# EasyEDA Pro project satelitesbol.eprj, schematic ADCS
Board Name: PCB5; Create Date: 2025-08-22; Page Name: Main Board; Project Name: satelitesbol; Schematic Name: ADCS; Update Date: 2025-08-27; Company: EasyEDA.com; Page Size: A4; Version: V1.0
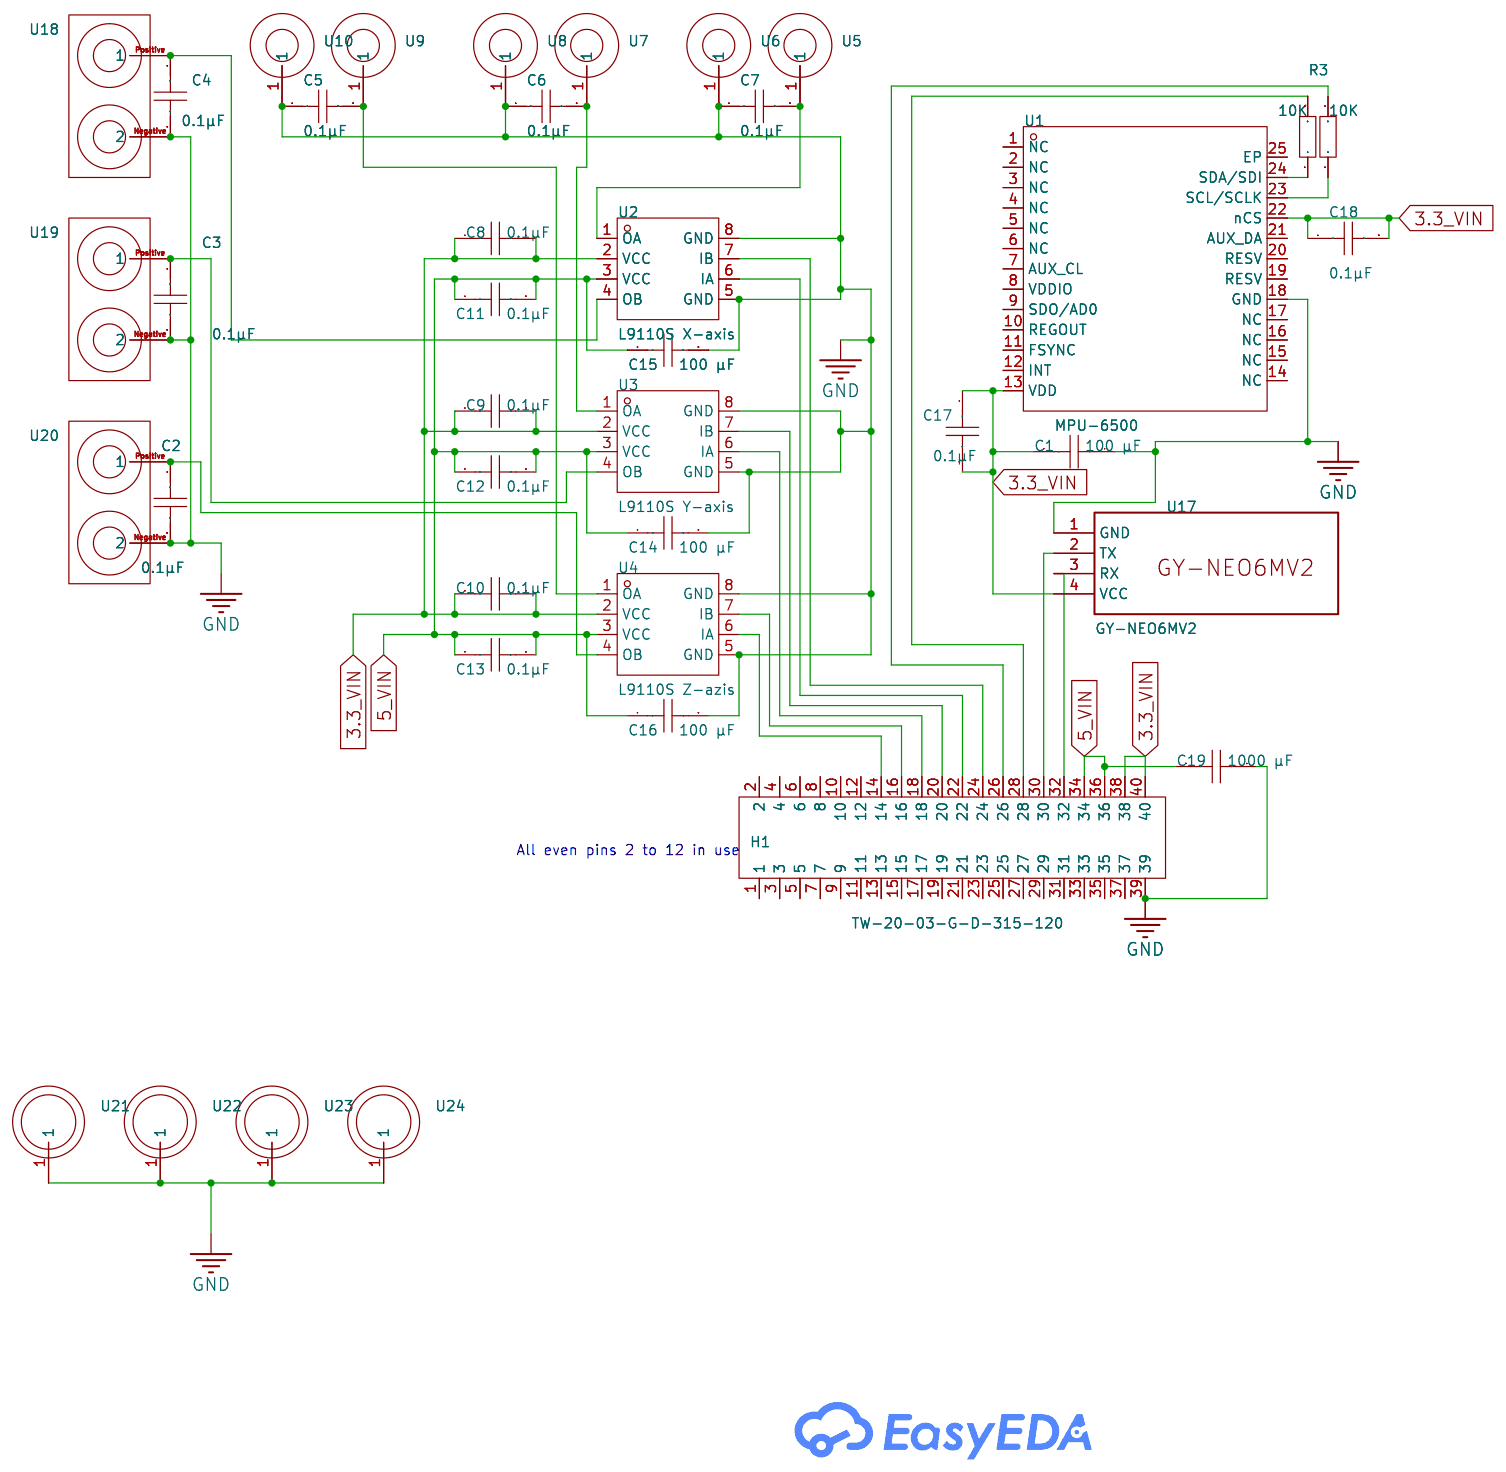
[diagram p2: schematic sheet]

## Parts
C1  100 µF  [C0805]
C2  0.1 µF  [C0805]
C3  0.1 µF  [C0805]
C4  0.1 µF  [C0805]
C5  0.1 µF  [C0805]
C6  0.1 µF  [C0805]
C7  0.1 µF  [C0805]
C8  0.1 µF  [C0805]
C9  0.1 µF  [C0805]
C10  0.1 µF  [C0805]
C11  0.1 µF  [C0805]
C12  0.1 µF  [C0805]
C13  0.1 µF  [C0805]
C14  100 µF  [C0805]
C15  100 µF  [C0805]
C16  100 µF  [C0805]
C17  0.1 µF  [C0805]
C18  0.1 µF  [C0805]
C19  1000 µF  [C0805]
H1  TW-20-03-G-D-315-120  [HDR-TH_40P-P2.00-V-M-R2-C20-S2.00-1]
R2  10K  [R0805]
R3  10K  [R0805]
U1  MPU-6500  [QFN-24_L3.0-W3.0-P0.40-BL-EP]
U2  L9110S X-axis  [SOP-8_L4.9-W3.9-P1.27-LS6.0-BL]
U3  L9110S Y-axis  [SOP-8_L4.9-W3.9-P1.27-LS6.0-BL]
U4  L9110S Z-azis  [SOP-8_L4.9-W3.9-P1.27-LS6.0-BL]
U5  -  [MOH]
U6  -  [MOH]
U7  -  [MOH]
U8  -  [MOH]
U9  -  [MOH]
U10  -  [MOH]
U17  GY-NEO6MV2  [NEO-6M-V2]
U18  -  [MG]
U19  -  [MG]
U20  -  [MG]
U21  -  [M_H]
U22  -  [M_H]
U23  -  [M_H]
U24  -  [M_H]

## Library data of the parts
C1-C19 = CAP_0201: Supplier Footprint: 0201
H1 = TW-20-03-G-D-315-120: LCSC Part Name: 间距:2mm 直插; Supplier Part: C7371248; Manufacturer: SAMTEC; Supplier Footprint: 插件,P=2mm; JLCPCB Part Class: Extended Part; Datasheet: https://item.szlcsc.com/datasheet/TW-20-03-G-D-315-120/8342295.html; Supplier: LCSC; Pitch: 2mm; Row Spacing: 2mm; Mounting Type: Through Hole; Number of Rows: 2; Number of Pins: 40P; Contact Plating: Gold; Color: Black
R2 R3 = Res_0603
U1 = MPU-6500_C50278: Supplier Part: C50278; Manufacturer: TDK InvenSense(应美盛); Supplier Footprint: QFN-24-EP(3x3); JLCPCB Part Class: Extended Part; Datasheet: https://item.szlcsc.com/datasheet/MPU-6500/51287.html; Supplier: LCSC; Sensor Type: Accelerometer gyroscope; Operating Temperature: -40℃~+85℃
U2-U4 = L9110S_C513306: LCSC Part Name: L9110; Supplier Part: C513306; Manufacturer: Mixic(中科芯亿达); Supplier Footprint: SOP-8; JLCPCB Part Class: Extended Part; Datasheet: https://item.szlcsc.com/datasheet/L9110S/528009.html; Supplier: LCSC; Peak Current: 2.5A; Operating Temperature: -20℃~+80℃
U5-U10 = MOH: motor holes
U17 = GY-NEO6MV2
U18-U20 = MG: magnetorquer
U21-U24 = M_H: mounting hole

## Nets
GND: C1.1 C2.2 C3.2 C4.2 C5.1 C6.1 C7.1 C14.2 C15.2 C16.2 C19.1 H1.39 U1.18(GND) U2.5(GND) U2.8(GND) U3.5(GND) U3.8(GND) U4.5(GND) U4.8(GND) U6.1 U8.1 U10.1 U17.1(GND) U18.Negative(2) U19.Negative(2) U20.Negative(2) U21.1 U22.1 U23.1 U24.1
3.3_VIN: C1.2 C8.1 C8.2 C9.1 C9.2 C10.1 C10.2 C17.1 C17.2 C18.1 C18.2 H1.38 H1.40 U1.13(VDD) U1.22(nCS) U2.2(VCC) U3.2(VCC) U4.2(VCC) U17.4(VCC)
5_VIN: C11.1 C11.2 C12.1 C12.2 C13.1 C13.2 C14.1 C15.1 C16.1 C19.2 H1.34 H1.36 U2.3(VCC) U3.3(VCC) U4.3(VCC)
Net-(C2-1): C2.1 U4.4(OB) U20.Positive(1)
Net-(C3-1): C3.1 U3.4(OB) U19.Positive(1)
Net-(C4-1): C4.1 U2.4(OB) U18.Positive(1)
Net-(C5-2): C5.2 U4.1(OA) U9.1
Net-(C6-2): C6.2 U3.1(OA) U7.1
Net-(C7-2): C7.2 U2.1(OA) U5.1
Net-(H1-14): H1.14 U4.6(IA)
Net-(H1-16): H1.16 U4.7(IB)
Net-(H1-18): H1.18 U3.6(IA)
Net-(H1-20): H1.20 U3.7(IB)
Net-(H1-22): H1.22 U2.6(IA)
Net-(H1-24): H1.24 U2.7(IB)
Net-(H1-26): H1.26 R2.2
Net-(H1-28): H1.28 R3.2
Net-(H1-30): H1.30 U17.2(TX)
Net-(H1-32): H1.32 U17.3(RX)
Net-(R2-1): R2.1 U1.23(SCL/SCLK)
Net-(R3-1): R3.1 U1.24(SDA/SDI)

Not connected (* = marked no-connect by the designer): H1 1 2 3 4 5 6 7 8 9 10 11 12 13 15 17 19 21 23 25 27 29 31 33 35 37; U1 1(NC) 2(NC) 3(NC) 4(NC) 5(NC) 6(NC) 7(AUX_CL) 8(VDDIO) 9(SDO/AD0) 10(REGOUT) 11(FSYNC) 12(INT) 14(NC) 15(NC) 16(NC) 17(NC) 19(RESV) 20(RESV) 21(AUX_DA) 25(EP)

## Notes on the sheet
- All even pins 2 to 12 in use
